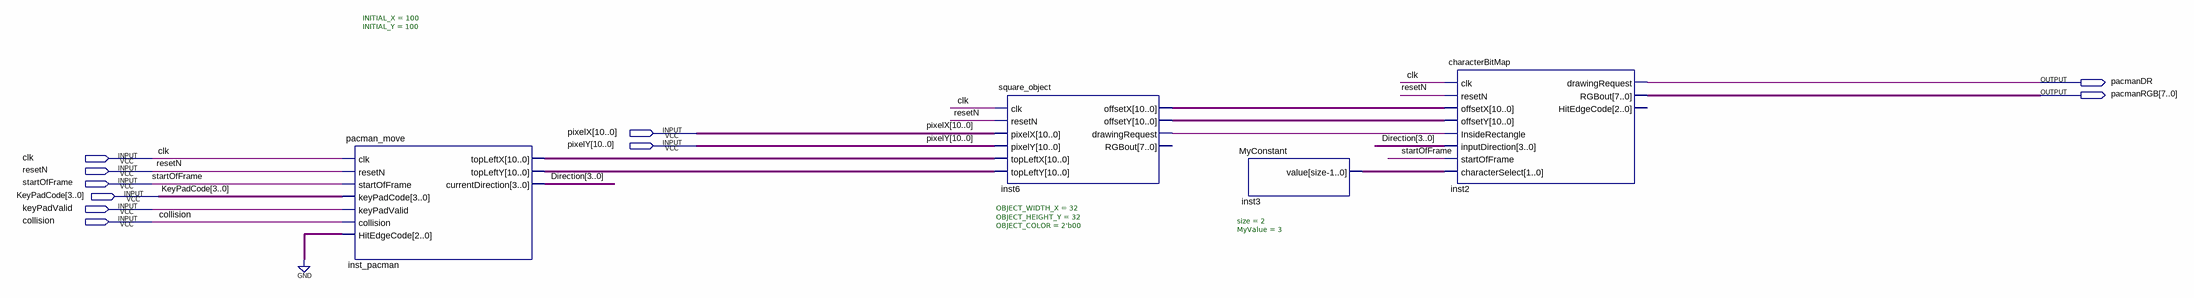
[diagram p0: schematic sheet]
// Quartus schematic Inky.bdf as structural Verilog: 4 symbols, 10 pins
module Inky (
  input  [10:0] pixelX,
  input  [10:0] pixelY,
  input  clk,
  input  resetN,
  input  startOfFrame,
  input  [3:0] KeyPadCode,
  input  keyPadValid,
  input  collision,
  output pacmanDR,
  output [7:0] pacmanRGB
);

  wire inst6_drawingrequest;
  wire [1:0] inst3_value;
  wire [3:0] Direction;
  wire [10:0] inst6_offsetx, inst6_offsety, inst_pacman_topleftx, inst_pacman_toplefty;

  pacman_move #(.INITIAL_X(100), .INITIAL_Y(100)) inst_pacman (
    .clk(clk), .resetN(resetN), .startOfFrame(startOfFrame), .keyPadCode(KeyPadCode),
    .keyPadValid(keyPadValid), .collision(collision), .HitEdgeCode(3'b000), .topLeftX(inst_pacman_topleftx),
    .topLeftY(inst_pacman_toplefty), .currentDirection(Direction));
  square_object #(.OBJECT_WIDTH_X(32), .OBJECT_HEIGHT_Y(32), .OBJECT_COLOR(2'b00)) inst6 (
    .clk(clk), .resetN(resetN), .pixelX(pixelX), .pixelY(pixelY), .topLeftX(inst_pacman_topleftx),
    .topLeftY(inst_pacman_toplefty), .offsetX(inst6_offsetx), .offsetY(inst6_offsety),
    .drawingRequest(inst6_drawingrequest));  // open: RGBout
  MyConstant #(.size(2), .MyValue(3)) inst3 (.value(inst3_value));
  characterBitMap inst2 (
    .clk(clk), .resetN(resetN), .offsetX(inst6_offsetx), .offsetY(inst6_offsety),
    .InsideRectangle(inst6_drawingrequest), .inputDirection(Direction), .startOfFrame(startOfFrame),
    .characterSelect(inst3_value), .drawingRequest(pacmanDR), .RGBout(pacmanRGB));  // open: HitEdgeCode
endmodule
